# Altium schematic sheet [3]RootSheet.SchDoc
size 431 x 279 mm; SheetNumber: 1; SheetTotal: 6
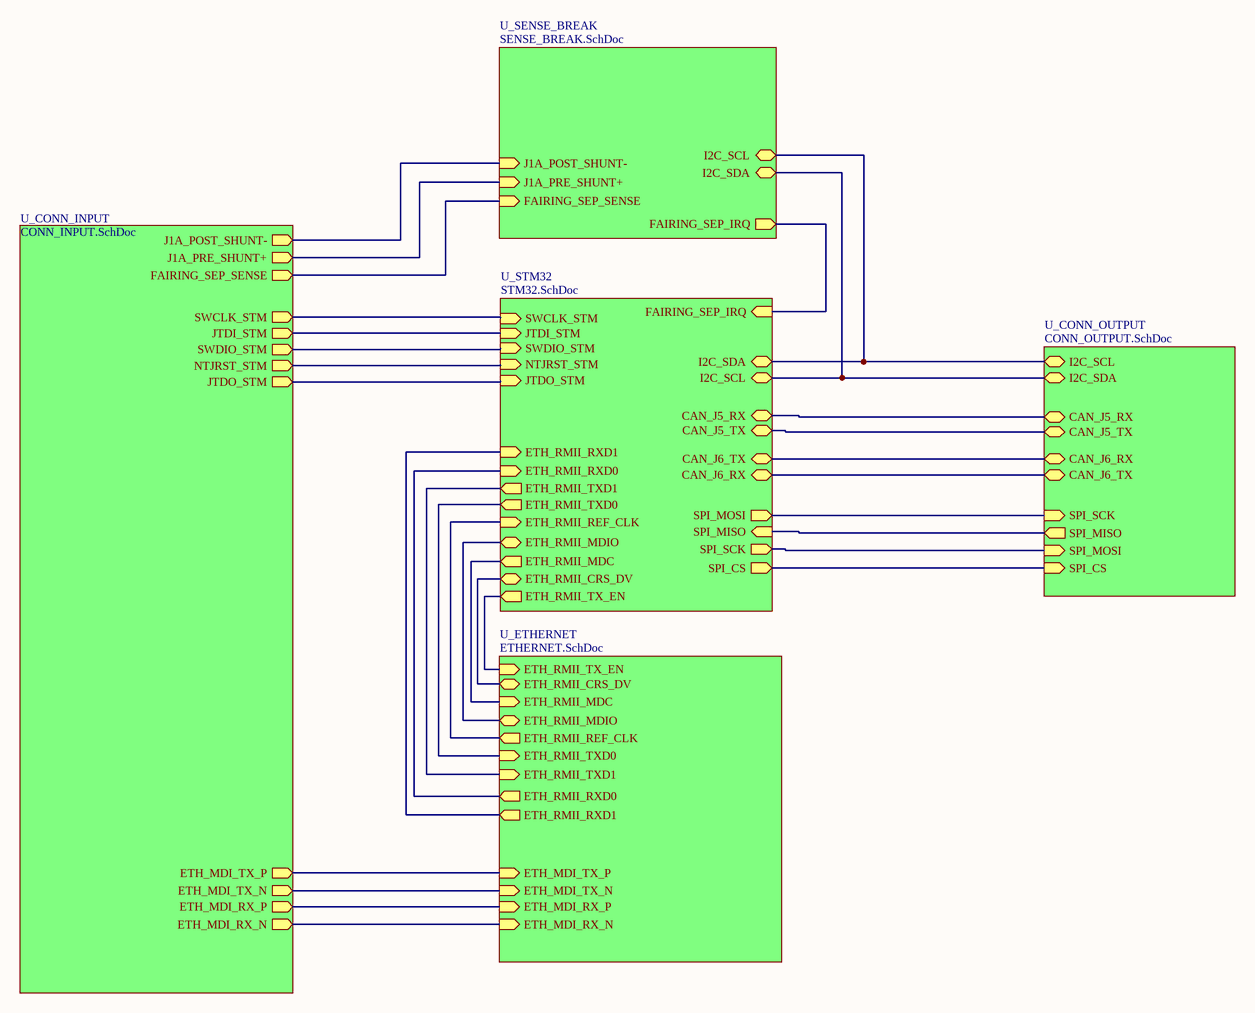
[diagram p0: [3]RootSheet.SchDoc]

## Sub-sheets
U_CONN_INPUT = CONN_INPUT.SchDoc: FAIRING_SEP_SENSE (out), J1A_PRE_SHUNT+ (out), J1A_POST_SHUNT- (out), ETH_MDI_RX_N (out), ETH_MDI_RX_P (out), ETH_MDI_TX_N (out), ETH_MDI_TX_P (out), SWCLK_STM (out), JTDI_STM (out), SWDIO_STM (out), NTJRST_STM (out), JTDO_STM (out)
U_CONN_OUTPUT = CONN_OUTPUT.SchDoc: I2C_SCL (bidir), I2C_SDA (bidir), CAN_J5_TX (bidir), CAN_J5_RX (bidir), CAN_J6_RX (bidir), CAN_J6_TX (bidir), SPI_SCK (in), SPI_MISO (out), SPI_MOSI (in), SPI_CS (in)
U_ETHERNET = ETHERNET.SchDoc: ETH_RMII_TX_EN (in), ETH_MDI_TX_P (in), ETH_RMII_CRS_DV (bidir), ETH_RMII_MDIO (bidir), ETH_RMII_REF_CLK (out), ETH_RMII_TXD0 (in), ETH_RMII_TXD1 (in), ETH_MDI_RX_N (in), ETH_MDI_RX_P (in), ETH_MDI_TX_N (in), ETH_RMII_RXD0 (out), ETH_RMII_RXD1 (out), ETH_RMII_MDC (in)
U_SENSE_BREAK = SENSE_BREAK.SchDoc: I2C_SCL (bidir), J1A_PRE_SHUNT+ (in), J1A_POST_SHUNT- (in), FAIRING_SEP_SENSE (in), FAIRING_SEP_IRQ (out), I2C_SDA (bidir)
U_STM32 = STM32.SchDoc: FAIRING_SEP_IRQ (in), I2C_SDA (bidir), I2C_SCL (bidir), CAN_J5_TX (bidir), CAN_J6_RX (bidir), CAN_J6_TX (bidir), CAN_J5_RX (bidir), SPI_MOSI (out), SPI_SCK (out), SPI_CS (out), ETH_RMII_TX_EN (out), ETH_RMII_CRS_DV (bidir), ETH_RMII_MDC (out), ETH_RMII_MDIO (bidir), ETH_RMII_REF_CLK (in), ETH_RMII_TXD0 (out), ETH_RMII_TXD1 (out), ETH_RMII_RXD0 (in), ETH_RMII_RXD1 (in), SWCLK_STM (in), JTDI_STM (in), SWDIO_STM (in), NTJRST_STM (in), JTDO_STM (in), SPI_MISO (in)

## Nets
(unnamed): sheet U_CONN_INPUT/FAIRING_SEP_SENSE, sheet U_SENSE_BREAK/FAIRING_SEP_SENSE
(unnamed): sheet U_CONN_INPUT/J1A_PRE_SHUNT+, sheet U_SENSE_BREAK/J1A_PRE_SHUNT+
(unnamed): sheet U_CONN_INPUT/J1A_POST_SHUNT-, sheet U_SENSE_BREAK/J1A_POST_SHUNT-
(unnamed): sheet U_CONN_INPUT/ETH_MDI_RX_N, sheet U_ETHERNET/ETH_MDI_RX_N
(unnamed): sheet U_CONN_INPUT/ETH_MDI_RX_P, sheet U_ETHERNET/ETH_MDI_RX_P
(unnamed): sheet U_CONN_INPUT/ETH_MDI_TX_N, sheet U_ETHERNET/ETH_MDI_TX_N
(unnamed): sheet U_CONN_INPUT/ETH_MDI_TX_P, sheet U_ETHERNET/ETH_MDI_TX_P
(unnamed): sheet U_CONN_INPUT/SWCLK_STM, sheet U_STM32/SWCLK_STM
(unnamed): sheet U_CONN_INPUT/JTDI_STM, sheet U_STM32/JTDI_STM
(unnamed): sheet U_CONN_INPUT/SWDIO_STM, sheet U_STM32/SWDIO_STM
(unnamed): sheet U_CONN_INPUT/NTJRST_STM, sheet U_STM32/NTJRST_STM
(unnamed): sheet U_CONN_INPUT/JTDO_STM, sheet U_STM32/JTDO_STM
(unnamed): sheet U_ETHERNET/ETH_RMII_TX_EN, sheet U_STM32/ETH_RMII_TX_EN
(unnamed): sheet U_ETHERNET/ETH_RMII_CRS_DV, sheet U_STM32/ETH_RMII_CRS_DV
(unnamed): sheet U_ETHERNET/ETH_RMII_MDIO, sheet U_STM32/ETH_RMII_MDIO
(unnamed): sheet U_ETHERNET/ETH_RMII_REF_CLK, sheet U_STM32/ETH_RMII_REF_CLK
(unnamed): sheet U_ETHERNET/ETH_RMII_TXD0, sheet U_STM32/ETH_RMII_TXD0
(unnamed): sheet U_ETHERNET/ETH_RMII_TXD1, sheet U_STM32/ETH_RMII_TXD1
(unnamed): sheet U_ETHERNET/ETH_RMII_RXD0, sheet U_STM32/ETH_RMII_RXD0
(unnamed): sheet U_ETHERNET/ETH_RMII_RXD1, sheet U_STM32/ETH_RMII_RXD1
(unnamed): sheet U_ETHERNET/ETH_RMII_MDC, sheet U_STM32/ETH_RMII_MDC
(unnamed): sheet U_STM32/FAIRING_SEP_IRQ, sheet U_SENSE_BREAK/FAIRING_SEP_IRQ
(unnamed): sheet U_STM32/I2C_SDA, sheet U_SENSE_BREAK/I2C_SCL, sheet U_CONN_OUTPUT/I2C_SCL
(unnamed): sheet U_STM32/I2C_SCL, sheet U_SENSE_BREAK/I2C_SDA, sheet U_CONN_OUTPUT/I2C_SDA
(unnamed): sheet U_STM32/CAN_J5_TX, sheet U_CONN_OUTPUT/CAN_J5_TX
(unnamed): sheet U_STM32/CAN_J6_RX, sheet U_CONN_OUTPUT/CAN_J6_TX
(unnamed): sheet U_STM32/CAN_J6_TX, sheet U_CONN_OUTPUT/CAN_J6_RX
(unnamed): sheet U_STM32/CAN_J5_RX, sheet U_CONN_OUTPUT/CAN_J5_RX
(unnamed): sheet U_STM32/SPI_MOSI, sheet U_CONN_OUTPUT/SPI_SCK
(unnamed): sheet U_STM32/SPI_SCK, sheet U_CONN_OUTPUT/SPI_MOSI
(unnamed): sheet U_STM32/SPI_CS, sheet U_CONN_OUTPUT/SPI_CS
(unnamed): sheet U_STM32/SPI_MISO, sheet U_CONN_OUTPUT/SPI_MISO